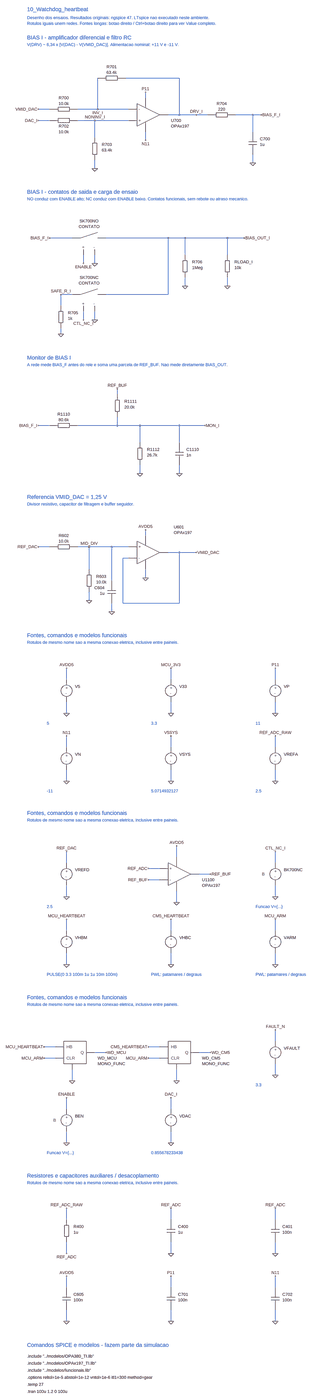
[diagram p0: schematic 10_Watchdog_heartbeat.asc, whole sheet]
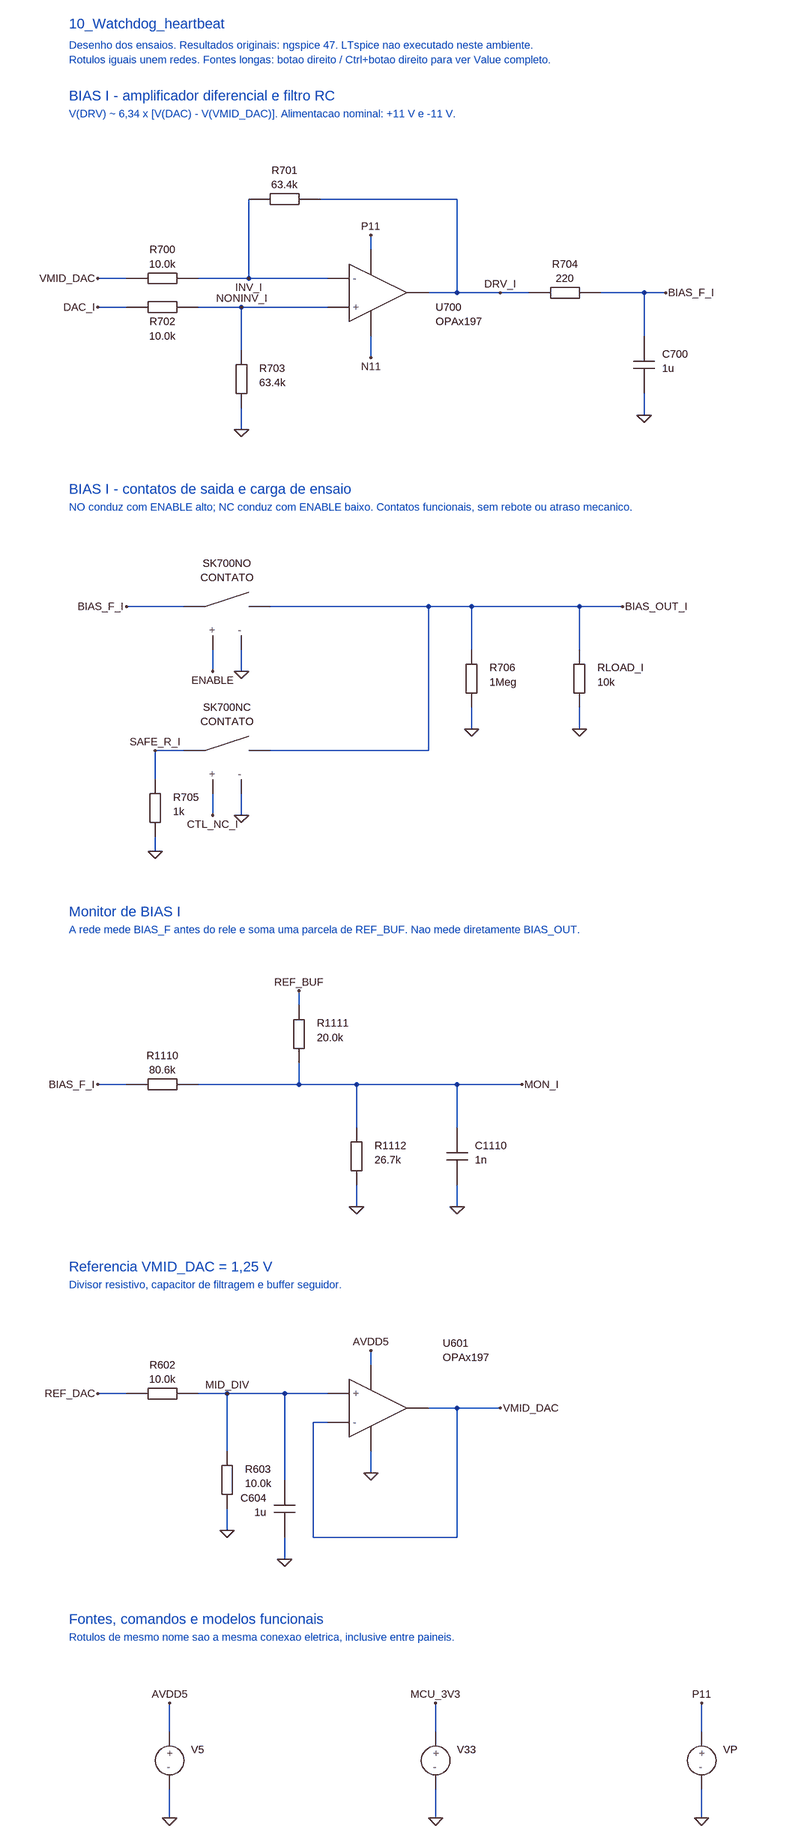
[diagram p1: schematic 10_Watchdog_heartbeat.asc, part, row 1 of 2, column 1 of 1]
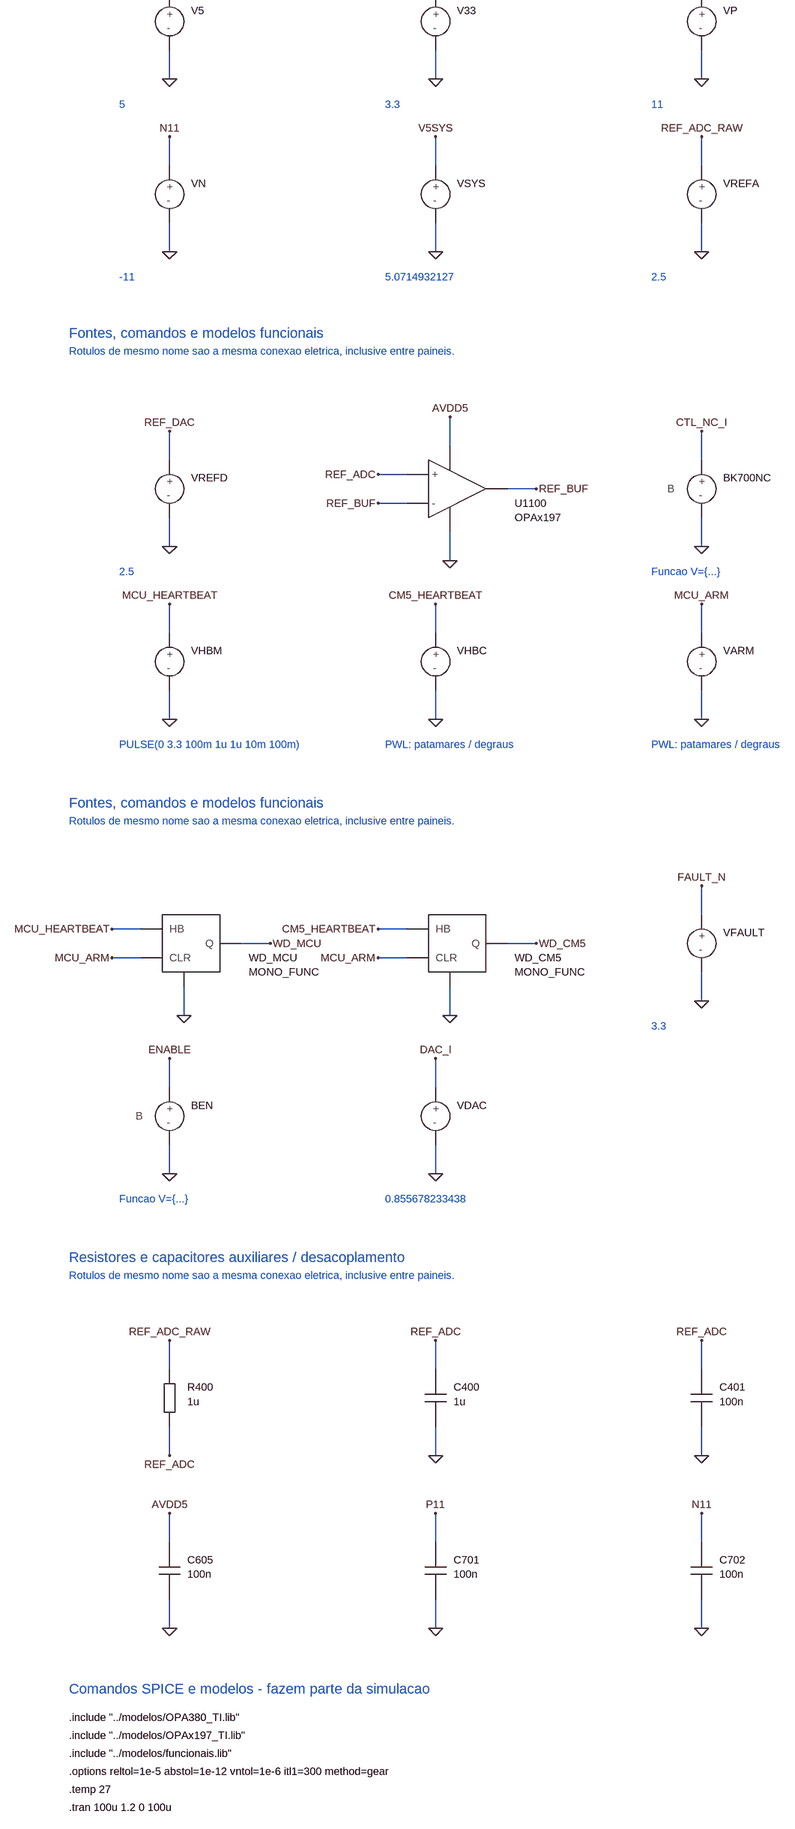
[diagram p2: schematic 10_Watchdog_heartbeat.asc, part, row 2 of 2, column 1 of 1]
10_Watchdog_heartbeat.asc, the LTspice schematic file:
Version 4.1
SHEET 1 1968 9216
TEXT 64 32 Left 3 ;10_Watchdog_heartbeat
TEXT 64 80 Left 2 ;Desenho dos ensaios. Resultados originais: ngspice 47. LTspice nao executado neste ambiente.
TEXT 64 112 Left 2 ;Rotulos iguais unem redes. Fontes longas: botao direito / Ctrl+botao direito para ver Value completo.
TEXT 64 192 Left 3 ;BIAS I - amplificador diferencial e filtro RC
TEXT 64 232 Left 2 ;V(DRV) ~ 6,34 x [V(DAC) - V(VMID_DAC)]. Alimentacao nominal: +11 V e -11 V.
WIRE 192 608 128 608
WIRE 352 608 640 608
WIRE 464 608 464 432
WIRE 624 432 928 432
WIRE 928 432 928 640
WIRE 928 640 864 640
WIRE 192 672 128 672
WIRE 352 672 640 672
WIRE 448 672 448 768
WIRE 448 896 448 944
WIRE 736 544 736 512
WIRE 736 736 736 784
WIRE 928 640 1088 640
WIRE 1248 640 1392 640
WIRE 1344 640 1344 736
WIRE 1344 864 1344 912
FLAG 128 608 VMID_DAC
FLAG 128 672 DAC_I
FLAG 448 944 0
FLAG 736 512 P11
FLAG 736 784 N11
FLAG 1024 640 DRV_I
FLAG 1392 640 BIAS_F_I
FLAG 1344 912 0
FLAG 464 608 INV_I
FLAG 448 672 NONINV_I
SYMBOL CV_RH 192 608 R0
SYMATTR InstName R700
SYMATTR Value 10.0k
SYMBOL CV_RHR 464 432 R0
SYMATTR InstName R701
SYMATTR Value 63.4k
SYMBOL CV_RHB 192 672 R0
SYMATTR InstName R702
SYMATTR Value 10.0k
SYMBOL CV_RV 448 768 R0
SYMATTR InstName R703
SYMATTR Value 63.4k
SYMBOL CV_OPD 704 576 R0
SYMATTR InstName U700
SYMATTR Value OPAx197
SYMBOL CV_RH 1088 640 R0
SYMATTR InstName R704
SYMATTR Value 220
SYMBOL CV_CV 1344 736 R0
SYMATTR InstName C700
SYMATTR Value 1u
TEXT 64 1200 Left 3 ;BIAS I - contatos de saida e carga de ensaio
TEXT 64 1240 Left 2 ;NO conduz com ENABLE alto; NC conduz com ENABLE baixo. Contatos funcionais, sem rebote ou atraso mecanico.
WIRE 320 1584 192 1584
WIRE 512 1584 1296 1584
WIRE 512 1904 864 1904
WIRE 864 1904 864 1584
WIRE 384 1680 384 1728
WIRE 448 1680 448 1728
WIRE 384 2000 384 2048
WIRE 448 2000 448 2048
WIRE 320 1904 256 1904
WIRE 256 1904 256 1968
WIRE 256 2096 256 2128
WIRE 960 1584 960 1680
WIRE 960 1808 960 1856
WIRE 1200 1584 1200 1680
WIRE 1200 1808 1200 1856
FLAG 192 1584 BIAS_F_I
FLAG 1296 1584 BIAS_OUT_I
FLAG 384 1728 ENABLE
FLAG 448 1728 0
FLAG 384 2048 CTL_NC_I
FLAG 448 2048 0
FLAG 256 1904 SAFE_R_I
FLAG 256 2128 0
FLAG 960 1856 0
FLAG 1200 1856 0
SYMBOL CV_SW 384 1584 R0
SYMATTR InstName SK700NO
SYMATTR Value CONTATO
SYMBOL CV_SW 384 1904 R0
SYMATTR InstName SK700NC
SYMATTR Value CONTATO
SYMBOL CV_RV 256 1968 R0
SYMATTR InstName R705
SYMATTR Value 1k
SYMBOL CV_RV 960 1680 R0
SYMATTR InstName R706
SYMATTR Value 1Meg
SYMBOL CV_RV 1200 1680 R0
SYMATTR InstName RLOAD_I
SYMATTR Value 10k
TEXT 64 2352 Left 3 ;Monitor de BIAS I
TEXT 64 2392 Left 2 ;A rede mede BIAS_F antes do rele e soma uma parcela de REF_BUF. Nao mede diretamente BIAS_OUT.
WIRE 192 2736 128 2736
WIRE 352 2736 1072 2736
WIRE 576 2560 576 2528
WIRE 576 2688 576 2736
WIRE 704 2736 704 2832
WIRE 704 2960 704 3008
WIRE 928 2736 928 2832
WIRE 928 2960 928 3008
FLAG 128 2736 BIAS_F_I
FLAG 1072 2736 MON_I
FLAG 576 2528 REF_BUF
FLAG 704 3008 0
FLAG 928 3008 0
SYMBOL CV_RH 192 2736 R0
SYMATTR InstName R1110
SYMATTR Value 80.6k
SYMBOL CV_RV 576 2560 R0
SYMATTR InstName R1111
SYMATTR Value 20.0k
SYMBOL CV_RV 704 2832 R0
SYMATTR InstName R1112
SYMATTR Value 26.7k
SYMBOL CV_CV 928 2832 R0
SYMATTR InstName C1110
SYMATTR Value 1n
TEXT 64 3248 Left 3 ;Referencia VMID_DAC = 1,25 V
TEXT 64 3288 Left 2 ;Divisor resistivo, capacitor de filtragem e buffer seguidor.
WIRE 192 3600 128 3600
WIRE 352 3600 640 3600
WIRE 416 3600 416 3728
WIRE 416 3856 416 3904
WIRE 544 3600 544 3792
WIRE 544 3920 544 3968
WIRE 736 3536 736 3504
WIRE 736 3728 736 3776
WIRE 640 3664 608 3664
WIRE 608 3664 608 3920
WIRE 608 3920 928 3920
WIRE 928 3920 928 3632
WIRE 928 3632 864 3632
WIRE 928 3632 1024 3632
FLAG 128 3600 REF_DAC
FLAG 416 3904 0
FLAG 544 3968 0
FLAG 736 3504 AVDD5
FLAG 736 3776 0
FLAG 1024 3632 VMID_DAC
FLAG 416 3600 MID_DIV
SYMBOL CV_RH 192 3600 R0
SYMATTR InstName R602
SYMATTR Value 10.0k
SYMBOL CV_RV 416 3728 R0
SYMATTR InstName R603
SYMATTR Value 10.0k
SYMBOL CV_CVL 544 3792 R0
SYMATTR InstName C604
SYMATTR Value 1u
SYMBOL CV_OPF 704 3568 R0
SYMATTR InstName U601
SYMATTR Value OPAx197
TEXT 64 4208 Left 3 ;Fontes, comandos e modelos funcionais
TEXT 64 4248 Left 2 ;Rotulos de mesmo nome sao a mesma conexao eletrica, inclusive entre paineis.
WIRE 288 4528 288 4464
WIRE 288 4656 288 4720
WIRE 880 4528 880 4464
WIRE 880 4656 880 4720
WIRE 1472 4528 1472 4464
WIRE 1472 4656 1472 4720
WIRE 288 4912 288 4848
WIRE 288 5040 288 5104
WIRE 880 4912 880 4848
WIRE 880 5040 880 5104
WIRE 1472 4912 1472 4848
WIRE 1472 5040 1472 5104
FLAG 288 4464 AVDD5
FLAG 288 4720 0
FLAG 880 4464 MCU_3V3
FLAG 880 4720 0
FLAG 1472 4464 P11
FLAG 1472 4720 0
FLAG 288 4848 N11
FLAG 288 5104 0
FLAG 880 4848 V5SYS
FLAG 880 5104 0
FLAG 1472 4848 REF_ADC_RAW
FLAG 1472 5104 0
SYMBOL CV_V 288 4528 R0
SYMATTR InstName V5
SYMATTR Value 5
SYMBOL CV_V 880 4528 R0
SYMATTR InstName V33
SYMATTR Value 3.3
SYMBOL CV_V 1472 4528 R0
SYMATTR InstName VP
SYMATTR Value 11
SYMBOL CV_V 288 4912 R0
SYMATTR InstName VN
SYMATTR Value -11
SYMBOL CV_V 880 4912 R0
SYMATTR InstName VSYS
SYMATTR Value 5.0714932127
SYMBOL CV_V 1472 4912 R0
SYMATTR InstName VREFA
SYMATTR Value 2.5
TEXT 176 4776 Left 2 ;5
TEXT 768 4776 Left 2 ;3.3
TEXT 1360 4776 Left 2 ;11
TEXT 176 5160 Left 2 ;-11
TEXT 768 5160 Left 2 ;5.0714932127
TEXT 1360 5160 Left 2 ;2.5
TEXT 64 5360 Left 3 ;Fontes, comandos e modelos funcionais
TEXT 64 5400 Left 2 ;Rotulos de mesmo nome sao a mesma conexao eletrica, inclusive entre paineis.
WIRE 288 5680 288 5616
WIRE 288 5808 288 5872
WIRE 816 5712 752 5712
WIRE 816 5776 752 5776
WIRE 912 5648 912 5584
WIRE 912 5840 912 5904
WIRE 1040 5744 1104 5744
WIRE 1472 5680 1472 5616
WIRE 1472 5808 1472 5872
WIRE 288 6064 288 6000
WIRE 288 6192 288 6256
WIRE 880 6064 880 6000
WIRE 880 6192 880 6256
WIRE 1472 6064 1472 6000
WIRE 1472 6192 1472 6256
FLAG 288 5616 REF_DAC
FLAG 288 5872 0
FLAG 752 5712 REF_ADC
FLAG 752 5776 REF_BUF
FLAG 912 5584 AVDD5
FLAG 912 5904 0
FLAG 1104 5744 REF_BUF
FLAG 1472 5616 CTL_NC_I
FLAG 1472 5872 0
FLAG 288 6000 MCU_HEARTBEAT
FLAG 288 6256 0
FLAG 880 6000 CM5_HEARTBEAT
FLAG 880 6256 0
FLAG 1472 6000 MCU_ARM
FLAG 1472 6256 0
SYMBOL CV_V 288 5680 R0
SYMATTR InstName VREFD
SYMATTR Value 2.5
SYMBOL CV_OP 880 5680 R0
SYMATTR InstName U1100
SYMATTR Value OPAx197
SYMBOL CV_B 1472 5680 R0
SYMATTR InstName BK700NC
SYMATTR Value V={3.3-V(ENABLE)}
SYMBOL CV_V 288 6064 R0
SYMATTR InstName VHBM
SYMATTR Value PULSE(0 3.3 100m 1u 1u 10m 100m)
SYMBOL CV_V 880 6064 R0
SYMATTR InstName VHBC
SYMATTR Value PWL(0 0 100m 0 100.001m 3.3 110m 3.3 110.001m 0 200m 0 200.001m 3.3 210m 3.3 210.001m 0 300m 0 300.001m 3.3 310m 3.3 310.001m 0 400m 0 400.001m 3.3 410m 3.3 410.001m 0 500m 0 500.001m 3.3)
SYMBOL CV_V 1472 6064 R0
SYMATTR InstName VARM
SYMATTR Value PWL(0 0 50m 0 50.001m 3.3)
TEXT 176 5928 Left 2 ;2.5
TEXT 1360 5928 Left 2 ;Funcao V={...}
TEXT 176 6312 Left 2 ;PULSE(0 3.3 100m 1u 1u 10m 100m)
TEXT 768 6312 Left 2 ;PWL: patamares / degraus
TEXT 1360 6312 Left 2 ;PWL: patamares / degraus
TEXT 64 6512 Left 3 ;Fontes, comandos e modelos funcionais
TEXT 64 6552 Left 2 ;Rotulos de mesmo nome sao a mesma conexao eletrica, inclusive entre paineis.
WIRE 224 6864 160 6864
WIRE 224 6928 160 6928
WIRE 448 6896 512 6896
WIRE 320 6992 320 7056
WIRE 816 6864 752 6864
WIRE 816 6928 752 6928
WIRE 1040 6896 1104 6896
WIRE 912 6992 912 7056
WIRE 1472 6832 1472 6768
WIRE 1472 6960 1472 7024
WIRE 288 7216 288 7152
WIRE 288 7344 288 7408
WIRE 880 7216 880 7152
WIRE 880 7344 880 7408
FLAG 160 6864 MCU_HEARTBEAT
FLAG 160 6928 MCU_ARM
FLAG 512 6896 WD_MCU
FLAG 320 7056 0
FLAG 752 6864 CM5_HEARTBEAT
FLAG 752 6928 MCU_ARM
FLAG 1104 6896 WD_CM5
FLAG 912 7056 0
FLAG 1472 6768 FAULT_N
FLAG 1472 7024 0
FLAG 288 7152 ENABLE
FLAG 288 7408 0
FLAG 880 7152 DAC_I
FLAG 880 7408 0
SYMBOL CV_MONO 288 6832 R0
SYMATTR InstName WD_MCU
SYMATTR Value MONO_FUNC
SYMBOL CV_MONO 880 6832 R0
SYMATTR InstName WD_CM5
SYMATTR Value MONO_FUNC
SYMBOL CV_V 1472 6832 R0
SYMATTR InstName VFAULT
SYMATTR Value 3.3
SYMBOL CV_B 288 7216 R0
SYMATTR InstName BEN
SYMATTR Value V={3.3*(1+tanh((V(WD_MCU)-2)/0.02))*(1+tanh((V(WD_CM5)-2)/0.02))*(1+tanh((V(FAULT_N)-2)/0.02))/8}
SYMBOL CV_V 880 7216 R0
SYMATTR InstName VDAC
SYMATTR Value 0.855678233438
TEXT 1360 7080 Left 2 ;3.3
TEXT 176 7464 Left 2 ;Funcao V={...}
TEXT 768 7464 Left 2 ;0.855678233438
TEXT 64 7664 Left 3 ;Resistores e capacitores auxiliares / desacoplamento
TEXT 64 7704 Left 2 ;Rotulos de mesmo nome sao a mesma conexao eletrica, inclusive entre paineis.
WIRE 288 7984 288 7920
WIRE 288 8112 288 8176
WIRE 880 7984 880 7920
WIRE 880 8112 880 8176
WIRE 1472 7984 1472 7920
WIRE 1472 8112 1472 8176
WIRE 288 8368 288 8304
WIRE 288 8496 288 8560
WIRE 880 8368 880 8304
WIRE 880 8496 880 8560
WIRE 1472 8368 1472 8304
WIRE 1472 8496 1472 8560
FLAG 288 7920 REF_ADC_RAW
FLAG 288 8176 REF_ADC
FLAG 880 7920 REF_ADC
FLAG 880 8176 0
FLAG 1472 7920 REF_ADC
FLAG 1472 8176 0
FLAG 288 8304 AVDD5
FLAG 288 8560 0
FLAG 880 8304 P11
FLAG 880 8560 0
FLAG 1472 8304 N11
FLAG 1472 8560 0
SYMBOL CV_RV 288 7984 R0
SYMATTR InstName R400
SYMATTR Value 1u
SYMBOL CV_CV 880 7984 R0
SYMATTR InstName C400
SYMATTR Value 1u
SYMBOL CV_CV 1472 7984 R0
SYMATTR InstName C401
SYMATTR Value 100n
SYMBOL CV_CV 288 8368 R0
SYMATTR InstName C605
SYMATTR Value 100n
SYMBOL CV_CV 880 8368 R0
SYMATTR InstName C701
SYMATTR Value 100n
SYMBOL CV_CV 1472 8368 R0
SYMATTR InstName C702
SYMATTR Value 100n
TEXT 64 8816 Left 3 ;Comandos SPICE e modelos - fazem parte da simulacao
TEXT 64 8880 Left 2 !.include "../modelos/OPA380_TI.lib"
TEXT 64 8920 Left 2 !.include "../modelos/OPAx197_TI.lib"
TEXT 64 8960 Left 2 !.include "../modelos/funcionais.lib"
TEXT 64 9000 Left 2 !.options reltol=1e-5 abstol=1e-12 vntol=1e-6 itl1=300 method=gear
TEXT 64 9040 Left 2 !.temp 27
TEXT 64 9080 Left 2 !.tran 100u 1.2 0 100u

The netlist it stands for:
* 10_Watchdog_heartbeat.asc
R700 VMID_DAC INV_I 10.0k
R701 DRV_I INV_I 63.4k
R702 DAC_I NONINV_I 10.0k
R703 NONINV_I 0 63.4k
X§U700 NONINV_I INV_I P11 N11 DRV_I OPAx197  ; pins + - V+ V- OUT
R704 DRV_I BIAS_F_I 220
C700 BIAS_F_I 0 1u
SK700NO BIAS_F_I BIAS_OUT_I ENABLE 0 CONTATO
SK700NC SAFE_R_I BIAS_OUT_I CTL_NC_I 0 CONTATO
R705 SAFE_R_I 0 1k
R706 BIAS_OUT_I 0 1Meg
RLOAD_I BIAS_OUT_I 0 10k
R1110 BIAS_F_I MON_I 80.6k
R1111 REF_BUF MON_I 20.0k
R1112 MON_I 0 26.7k
C1110 MON_I 0 1n
R602 REF_DAC MID_DIV 10.0k
R603 MID_DIV 0 10.0k
C604 MID_DIV 0 1u
X§U601 MID_DIV VMID_DAC AVDD5 0 VMID_DAC OPAx197  ; pins + - V+ V- OUT
V5 AVDD5 0 5
V33 MCU_3V3 0 3.3
VP P11 0 11
VN N11 0 -11
VSYS V5SYS 0 5.0714932127
VREFA REF_ADC_RAW 0 2.5
VREFD REF_DAC 0 2.5
X§U1100 REF_ADC REF_BUF AVDD5 0 REF_BUF OPAx197  ; pins + - V+ V- OUT
BK700NC CTL_NC_I 0 V={3.3-V(ENABLE)}
VHBM MCU_HEARTBEAT 0 PULSE(0 3.3 100m 1u 1u 10m 100m)
VHBC CM5_HEARTBEAT 0 PWL(0 0 100m 0 100.001m 3.3 110m 3.3 110.001m 0 200m 0 200.001m 3.3 210m 3.3 210.001m 0 300m 0 300.001m 3.3 310m 3.3 310.001m 0 400m 0 400.001m 3.3 410m 3.3 410.001m 0 500m 0 500.001m 3.3)
VARM MCU_ARM 0 PWL(0 0 50m 0 50.001m 3.3)
X§WD_MCU MCU_HEARTBEAT MCU_ARM WD_MCU 0 MONO_FUNC  ; pins HB CLR Q G
X§WD_CM5 CM5_HEARTBEAT MCU_ARM WD_CM5 0 MONO_FUNC  ; pins HB CLR Q G
VFAULT FAULT_N 0 3.3
BEN ENABLE 0 V={3.3*(1+tanh((V(WD_MCU)-2)/0.02))*(1+tanh((V(WD_CM5)-2)/0.02))*(1+tanh((V(FAULT_N)-2)/0.02))/8}
VDAC DAC_I 0 0.855678233438
R400 REF_ADC_RAW REF_ADC 1u
C400 REF_ADC 0 1u
C401 REF_ADC 0 100n
C605 AVDD5 0 100n
C701 P11 0 100n
C702 N11 0 100n
* 10_Watchdog_heartbeat
* Desenho dos ensaios. Resultados originais: ngspice 47. LTspice nao executado neste ambiente.
* Rotulos iguais unem redes. Fontes longas: botao direito / Ctrl+botao direito para ver Value completo.
* BIAS I - amplificador diferencial e filtro RC
* V(DRV) ~ 6,34 x [V(DAC) - V(VMID_DAC)]. Alimentacao nominal: +11 V e -11 V.
* BIAS I - contatos de saida e carga de ensaio
* NO conduz com ENABLE alto; NC conduz com ENABLE baixo. Contatos funcionais, sem rebote ou atraso mecanico.
* Monitor de BIAS I
* A rede mede BIAS_F antes do rele e soma uma parcela de REF_BUF. Nao mede diretamente BIAS_OUT.
* Referencia VMID_DAC = 1,25 V
* Divisor resistivo, capacitor de filtragem e buffer seguidor.
* Fontes, comandos e modelos funcionais
* Rotulos de mesmo nome sao a mesma conexao eletrica, inclusive entre paineis.
* 5
* 3.3
* 11
* -11
* 5.0714932127
* 2.5
* Fontes, comandos e modelos funcionais
* Rotulos de mesmo nome sao a mesma conexao eletrica, inclusive entre paineis.
* 2.5
* Funcao V={...}
* PULSE(0 3.3 100m 1u 1u 10m 100m)
* PWL: patamares / degraus
* PWL: patamares / degraus
* Fontes, comandos e modelos funcionais
* Rotulos de mesmo nome sao a mesma conexao eletrica, inclusive entre paineis.
* 3.3
* Funcao V={...}
* 0.855678233438
* Resistores e capacitores auxiliares / desacoplamento
* Rotulos de mesmo nome sao a mesma conexao eletrica, inclusive entre paineis.
* Comandos SPICE e modelos - fazem parte da simulacao
.include "../modelos/OPA380_TI.lib"
.include "../modelos/OPAx197_TI.lib"
.include "../modelos/funcionais.lib"
.options reltol=1e-5 abstol=1e-12 vntol=1e-6 itl1=300 method=gear
.temp 27
.tran 100u 1.2 0 100u
.backanno
.end